# Altium schematic sheet 04_Power.SchDoc
size A; SheetNumber: 4; SheetTotal: 5
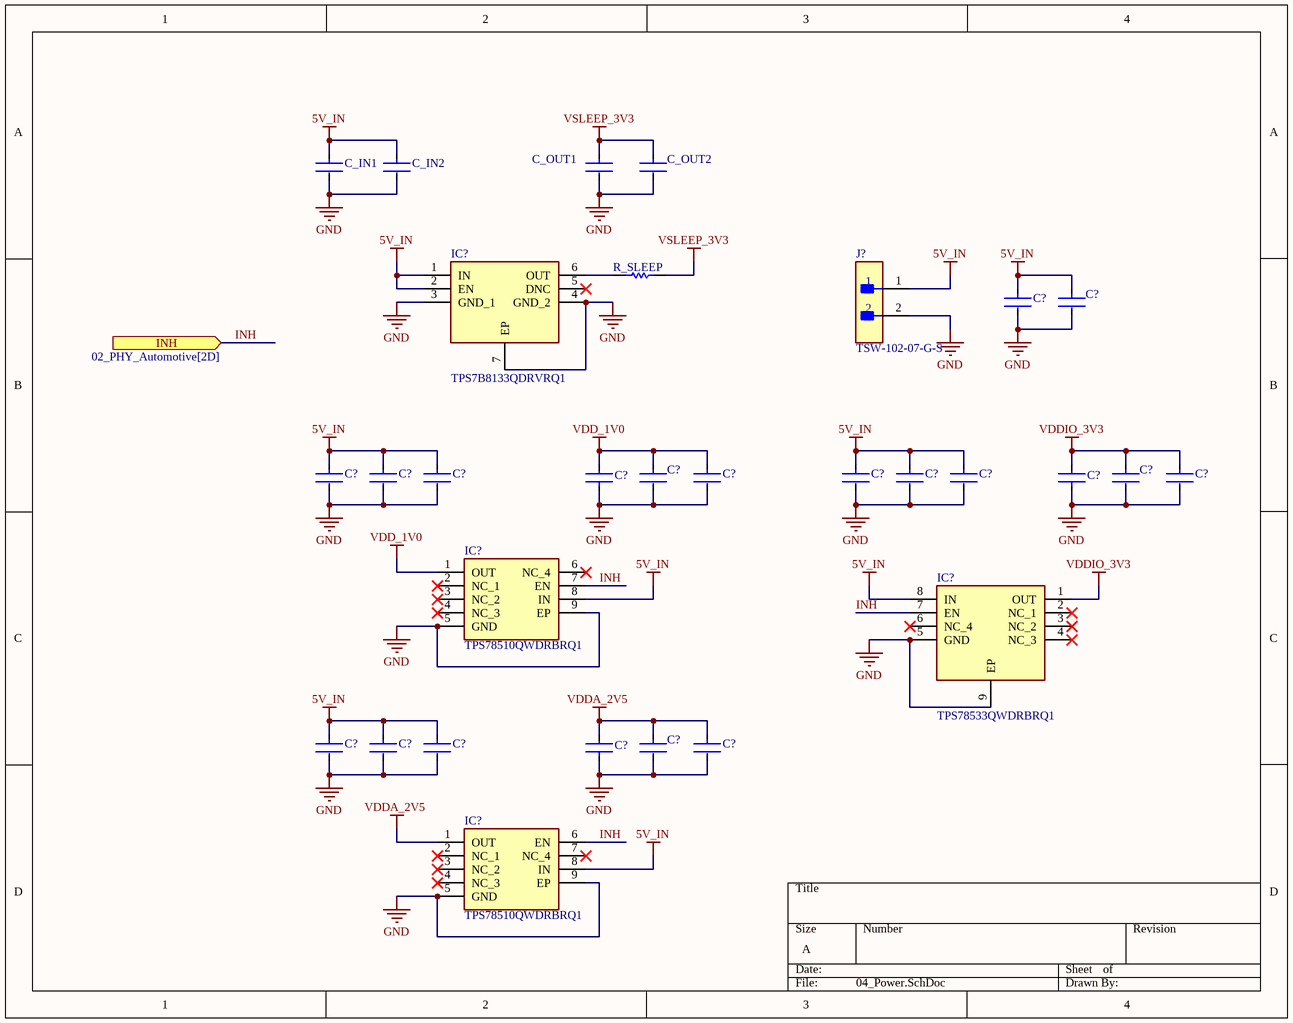
[diagram p0: 04_Power.SchDoc]

## Parts
(Parts that share a designator on the sheet are numbered #1, #2 ... from top to bottom, then left to right.)
C?#1  GCM32ER71C226ME19K  [FP-GCM32E-0_3-IPC_A]  (value not drawn)
C?#2  GCG155R71C104KA01D  [FP-GCG155-0_1-IPC_C]  (value not drawn)
C?#3  C1206C106K4RACAUTO  [FP-C1206C-EH-MFG]  (value not drawn)
C?#4  GCG155R71C104KA01D  [FP-GCG155-0_1-IPC_C]  (value not drawn)
C?#5  (no value)  [FP-GCG155-0_1-IPC_C]
C?#6  GCG155R71C104KA01D  [FP-GCG155-0_1-IPC_C]  (value not drawn)
C?#7  (no value)  [FP-GCG155-0_1-IPC_C]
C?#8  C1206C106K4RACAUTO  [FP-C1206C-EH-MFG]  (value not drawn)
C?#9  GCG155R71C104KA01D  [FP-GCG155-0_1-IPC_C]  (value not drawn)
C?#10  (no value)  [FP-GCG155-0_1-IPC_C]
C?#11  GCG155R71C104KA01D  [FP-GCG155-0_1-IPC_C]  (value not drawn)
C?#12  (no value)  [FP-GCG155-0_1-IPC_C]
C?#13  C0603C105K8RACAUTO  [FP-C0603-CJ-MFG]  (value not drawn)
C?#14  C0603C105K8RACAUTO  [FP-C0603-CJ-MFG]  (value not drawn)
C?#15  C1206C106K4RACAUTO  [FP-C1206C-EH-MFG]  (value not drawn)
C?#16  GCG155R71C104KA01D  [FP-GCG155-0_1-IPC_C]  (value not drawn)
C?#17  (no value)  [FP-GCG155-0_1-IPC_C]
C?#18  GCG155R71C104KA01D  [FP-GCG155-0_1-IPC_C]  (value not drawn)
C?#19  (no value)  [FP-GCG155-0_1-IPC_C]
C?#20  C0603C105K8RACAUTO  [FP-C0603-CJ-MFG]  (value not drawn)
C_IN1  C1206C106K4RACAUTO  [FP-C1206C-EH-MFG]  (value not drawn)
C_IN2  GCG155R71C104KA01D  [FP-GCG155-0_1-IPC_C]  (value not drawn)
C_OUT1  C1206C106K4RACAUTO  [FP-C1206C-EH-MFG]  (value not drawn)
C_OUT2  GCG155R71C104KA01D  [FP-GCG155-0_1-IPC_C]  (value not drawn)
IC?#1  TPS7B8133QDRVRQ1  [SON65P200X200X80-7N]
IC?#2  TPS78510QWDRBRQ1  [TPS78510QWDRBRQ1]
IC?#3  TPS78533QWDRBRQ1  [SON65P300X300X100-9N-D]
IC?#4  TPS78510QWDRBRQ1  [TPS78510QWDRBRQ1]
J?  TSW-102-07-G-S  [FP-TSW-102-07-G-S-MFG]
R_SLEEP  AF0402JR-070RL  [FP-AC0402-IPC_A]  (value not drawn)

## Ports
INH (in, see 02_PHY_Automotive[2D])

## Nets
5V_IN: C?#1.2 C?#2.1 C?#3.1 C?#4.1 C?#5.1 C?#8.1 C?#9.1 C?#10.1 C?#15.1 C?#16.1 C?#17.1 C_IN1.1 C_IN2.1 IC?#1.1(IN) IC?#1.2(EN) IC?#2.8(IN) IC?#3.8(IN) IC?#4.8(IN) J?.1
GND: C?#1.1 C?#2.2 C?#3.2 C?#4.2 C?#5.2 C?#6.2 C?#7.2 C?#8.2 C?#9.2 C?#10.2 C?#11.2 C?#12.2 C?#13.2 C?#14.2 C?#15.2 C?#16.2 C?#17.2 C?#18.2 C?#19.2 C?#20.2 C_IN1.2 C_IN2.2 C_OUT1.2 C_OUT2.2 IC?#1.3(GND_1) IC?#1.4(GND_2) IC?#1.7(EP) IC?#2.5(GND) IC?#2.9(EP) IC?#3.5(GND) IC?#3.9(EP) IC?#4.5(GND) IC?#4.9(EP) J?.2
VDD_1V0: C?#6.1 C?#7.1 C?#13.1 IC?#2.1(OUT)
VDDA_2V5 : C?#18.1 C?#19.1 C?#20.1 IC?#4.1(OUT)
VDDIO_3V3: C?#11.1 C?#12.1 C?#14.1 IC?#3.1(OUT)
VSLEEP_3V3: C_OUT1.1 C_OUT2.1 R_SLEEP.1
INH: IC?#2.7(EN) IC?#3.7(EN) IC?#4.6(EN) ; port INH
NetIC?#1_6: IC?#1.6(OUT) R_SLEEP.2

Not connected (* = marked no-connect by the designer): IC?#1 5(DNC)*; IC?#2 2(NC_1)* 3(NC_2)* 4(NC_3)* 6(NC_4)*; IC?#3 2(NC_1)* 3(NC_2)* 4(NC_3)* 6(NC_4)*; IC?#4 2(NC_1)* 3(NC_2)* 4(NC_3)* 7(NC_4)*

## Library data of the parts
C?#1 = CMP-06035-020351-1: Ceramic Capacitor for Automotive 22uF ±20% 16VDC X7R 1210 Embossed T/R; Voltage Rating: 16V; Case Code (Imperial): 1210; Package Quantity: 4000; Min Operating Temperature: -55°C; Thickness: 0.106inch; Case/Package: 1210; Height: 2.5mm; Width: 0.098inch; Dielectric: X7R; Ratings: AEC-Q200; Case Code (Metric): 3225; Weight: 0.00388oz; Voltage Rating (DC): 16V; Length: 0.126inch; Tolerance: 20%; Capacitance: 22uF; Mount: Surface Mount; Packaging: Tape and Reel; Max Operating Temperature: 125°C; Termination: SMD/SMT
C?#2 C?#4 C?#6 C?#9 C?#11 C?#16 C?#18 C_IN2 C_OUT2 = CMP-06035-054249-1: Cap Ceramic Multilayer Automotive 0.1uF ±0.1 16VDC X7R 15% 0402 (1005M); Capacitance: 100nF; Tolerance: 10%; Voltage Rating (DC): 16V; Lead Free: Lead Free; Dielectric: X7R
C?#3 C?#8 C?#15 = CMP-03020-003375-1: CAP CER 10UF 16V X7R 1206; Manufacturer: Kemet; Material: Ceramic; Temperature Coefficient: 15%; Tolerance: 10%; Automotive Grade: Grade 1; Manufacturer Part Number: C1206C106K4RACAUTO; Digikey Description: CAP CER 10UF 16V X7R 1206; RoHS: TRUE; Temperature Range Low: -55°C; Ipc Land Pattern Name: CAPC320160X160; Category: Cap; Mouser Description: Multilayer Ceramic Capacitors MLCC - SMD/SMT 10uF 16V 10% AUTO; Device Class L1: Passive Components; Automotive: Yes; ComponentLink2Description: Datasheet; Octopart: https://octopart.com/c1206c106k4racauto-kemet-20072893; Package: C1206C-EH; Temperature: -55°C to +125°C; Device Class L3: Ceramic Capacitors; Device Class L2: Capacitors; Temperature Range High: +125°C; Capacitance: 10uF; Value: 10uF; Lead Free: Yes; Height: 1.8mm; Temperature Characteristic: X7R; ComponentLink2URL: https://content.kemet.com/datasheets/KEM_C1023_X7R_AUTO_SMD.pdf; Voltage Rating: 16V
C?#5 C?#7 C?#10 C?#12 C?#17 C?#19 = CMP-06035-054249-1: Multilayer Ceramic Capacitors MLCC - SMD/SMT 16V 0.047uF X7R 0402 10% AEC-Q200; Manufacturer: Yageo Group; Manufacturer Part Number: C0402C473K4RACAUTO; Value: 47nF; Supplier: Avnet; Supplier Part Number: C0402C473K4RACAUTO; RoHS: Compliant; Category: Ceramic Capacitors; Stock: 10000; Pricing: 1=0.142, 25=0.072, 100=0.071, 250=0.069, 500=0.068, 1000=0.066, 2500=0.065 (USD); Case/Package: 0402; China RoHS: Compliant; Country of Origin: Mexico; Dielectric: X7R; Dielectric Material: Ceramic; Export Control Classification Number (ECCN) Code: EAR99; Height: 500µm; Harmonized Tariff Schedule (HTS) Code: 8532.24.00.20; Introduction Date: 2012-06-13; Length: 1mm; Lifecycle Status: Production; Material: Ceramic; Max Operating Temperature: 125°C; Min Operating Temperature: -55°C; Mounting Technology: Surface Mount; Pins: 2; Number of Terminals: 2; Ratings: AEC-Q200; REACH SVHC: Unaffected; Schedule B: 8532240020, 8532240020|8532240020|8532240020|8532240020|8532240020; Tolerance: 10%; Voltage Rating: 16V; Voltage Rating (DC): 16V; Width: 500µm; ComponentLink1URL: https://datasheet.octopart.com:443/C0402C473K4RACAUTO-KEMET-datasheet-178087915.pdf?src-supplier=Farnell; ComponentLink1Description: https://datasheet.octopart.com:443/C0402C473K4RACAUTO-KEMET-datasheet-178087915.pdf?src-supplier=Farnell; ComponentLink2URL: https://datasheet.octopart.com:443/C0402C473K4RACAUTO-KEMET-datasheet-149521753.pdf?src-supplier=Farnell; ComponentLink2Description: https://datasheet.octopart.com:443/C0402C473K4RACAUTO-KEMET-datasheet-149521753.pdf?src-supplier=Farnell; ComponentLink3URL: https://datasheet.octopart.com:443/C0402C473K4RACAUTO-KEMET-datasheet-101607585.pdf?src-supplier=Farnell; ComponentLink3Description: https://datasheet.octopart.com:443/C0402C473K4RACAUTO-KEMET-datasheet-101607585.pdf?src-supplier=Farnell; ComponentLink4URL: https://datasheet.octopart.com:443/C0402C473K4RACAUTO-KEMET-datasheet-138896278.pdf?src-supplier=Farnell; ComponentLink4Description: https://datasheet.octopart.com:443/C0402C473K4RACAUTO-KEMET-datasheet-138896278.pdf?src-supplier=Farnell; ComponentLink5URL: https://datasheet.octopart.com:443/C0402C473K4RACAUTO-KEMET-datasheet-137357759.pdf?src-supplier=Master+Electronics; ComponentLink5Description: https://datasheet.octopart.com:443/C0402C473K4RACAUTO-KEMET-datasheet-137357759.pdf?src-supplier=Master+Electronics; ComponentLink6URL: https://datasheet.octopart.com:443/C0402C473K4RACAUTO-KEMET-datasheet-153706760.pdf?src-supplier=Electro+Sonic; ComponentLink6Description: https://datasheet.octopart.com:443/C0402C473K4RACAUTO-KEMET-datasheet-153706760.pdf?src-supplier=Electro+Sonic; ComponentLink7URL: https://datasheet.octopart.com:443/C0402C473K4RACAUTO-KEMET-datasheet-153410967.pdf?src-supplier=LKR; ComponentLink7Description: https://datasheet.octopart.com:443/C0402C473K4RACAUTO-KEMET-datasheet-153410967.pdf?src-supplier=LKR; ComponentLink8URL: https://datasheet.octopart.com:443/C0402C473K4RACAUTO-KEMET-datasheet-130259128.pdf?src-supplier=TME; ComponentLink8Description: https://datasheet.octopart.com:443/C0402C473K4RACAUTO-KEMET-datasheet-130259128.pdf?src-supplier=TME; ComponentLink9URL: https://datasheet.octopart.com:443/C0402C473K4RACAUTO-KEMET-datasheet-130256447.pdf?src-supplier=TME; ComponentLink9Description: https://datasheet.octopart.com:443/C0402C473K4RACAUTO-KEMET-datasheet-130256447.pdf?src-supplier=TME; ComponentLink10URL: https://datasheet.octopart.com/C0402C473K4RACAUTO-KEMET-datasheet-84169754.pdf; ComponentLink10Description: https://datasheet.octopart.com/C0402C473K4RACAUTO-KEMET-datasheet-84169754.pdf
C?#13 C?#14 C?#20 = CMP-03020-024138-1: CAP CER 0603 1UF 10V X7R 10%; Manufacturer: KEMET; Temperature Coefficient: 15%; Automotive Grade: Grade 1; Material: Ceramic; Device Class L3: Ceramic Capacitors; Octopart: https://octopart.com/c0603c105k8racauto-kemet-91328492; Capacitance: 1uF; Voltage Rating: 10V; Device Class L2: Capacitors; Lead Free: Yes; Device Class L1: Passive Components; ComponentLink2URL: https://content.kemet.com/datasheets/KEM_C1023_X7R_AUTO_SMD.pdf; Temperature Characteristic: X7R; Temperature Range Low: -55°C; Temperature Range High: +125°C; Category: Cap; Ipc Land Pattern Name: CAPC16080X80; Tolerance: 10%; Package: C0603-CJ; Manufacturer Part Number: C0603C105K8RACAUTO; ComponentLink2Description: Datasheet; Temperature: -55°C to +125°C; RoHS: TRUE; Value: 1uF; Height: 0.95mm; Automotive: Yes; Digikey Description: CAP CER 0603 1UF 10V X7R 10%
C_IN1 C_OUT1 = CMP-03020-003375-1: CAP CER 10UF 16V X7R 1206; Manufacturer: Kemet; Temperature Coefficient: 15%; Tolerance: 10%; Automotive Grade: Grade 1; Manufacturer Part Number: C1206C106K4RACAUTO; Digikey Description: CAP CER 10UF 16V X7R 1206; RoHS: TRUE; Temperature Range Low: -55°C; Material: Ceramic; Ipc Land Pattern Name: CAPC320160X160; Category: Cap; Mouser Description: Multilayer Ceramic Capacitors MLCC - SMD/SMT 10uF 16V 10% AUTO; Device Class L1: Passive Components; Automotive: Yes; ComponentLink2Description: Datasheet; Octopart: https://octopart.com/c1206c106k4racauto-kemet-20072893; Package: C1206C-EH; Temperature: -55°C to +125°C; Device Class L3: Ceramic Capacitors; Device Class L2: Capacitors; Temperature Range High: +125°C; Capacitance: 10uF; Value: 10uF; Lead Free: Yes; Height: 1.8mm; Temperature Characteristic: X7R; ComponentLink2URL: https://content.kemet.com/datasheets/KEM_C1023_X7R_AUTO_SMD.pdf; Voltage Rating: 16V
IC?#1 = TPS7B8133QDRVRQ1: Integrated Circuit; Manufacturer_Name: Texas Instruments; Datasheet Link: http://www.ti.com/lit/gpn/TPS7B81-Q1; Height: 0.8mm; Manufacturer_Part_Number: TPS7B8133QDRVRQ1; Mouser Part Number: 595-TPS7B8133QDRVRQ1; Mouser Price/Stock: https://www.mouser.co.uk/ProductDetail/Texas-Instruments/TPS7B8133QDRVRQ1?qs=T3oQrply3y%252BtI31t7KSUmw%3D%3D; Arrow Part Number: TPS7B8133QDRVRQ1; Arrow Price/Stock: https://www.arrow.com/en/products/tps7b8133qdrvrq1/texas-instruments.html?utm_currency=USD&region=nac
IC?#2 IC?#4 = TPS78510QWDRBRQ1: Integrated Circuit; Manufacturer_Name: Texas Instruments; Datasheet Link: https://www.ti.com/lit/ds/symlink/tps785-q1.pdf?ts=1654240765019&ref_url=https%253A%252F%252Fcomponentsearchengine.com%252F; Height: 1mm; Manufacturer_Part_Number: TPS78510QWDRBRQ1; Mouser Part Number: 595-TPS78510QWDRBRQ1; Mouser Price/Stock: https://www.mouser.co.uk/ProductDetail/Texas-Instruments/TPS78510QWDRBRQ1?qs=iLbezkQI%252BsglWOoYBSvTYg%3D%3D; Arrow Part Number: TPS78510QWDRBRQ1; Arrow Price/Stock: https://www.arrow.com/en/products/tps78510qwdrbrq1/texas-instruments?region=nac
IC?#3 = TPS78533QWDRBRQ1: Integrated Circuit; Manufacturer_Name: Texas Instruments; Datasheet Link: https://www.arrow.com/en/products/tps78533qwdrbrq1/texas-instruments?region=nac; Height: 1mm; Manufacturer_Part_Number: TPS78533QWDRBRQ1; Mouser Part Number: 595-TPS78533QWDRBRQ1; Mouser Price/Stock: https://www.mouser.co.uk/ProductDetail/Texas-Instruments/TPS78533QWDRBRQ1?qs=iLbezkQI%252BsiNbdqh2Ko9GQ%3D%3D; Arrow Part Number: TPS78533QWDRBRQ1; Arrow Price/Stock: https://www.arrow.com/en/products/tps78533qwdrbrq1/texas-instruments?utm_currency=USD&region=nac
J? = CMP-02766-000084-1: CONN HEADER VERT 2POS 2.54MM; Manufacturer: Samtec; Number Of Contacts: 2; Voltage Rating: 550V; Conn Orientation: Straight; Current Rating: 6.3A; Description: Connector Header Through Hole 2 position 0.100" (2.54mm); Conn Gender: Male; Package: TSW-102-07-G-S; Digikey Description: CONN HEADER VERT 2POS 2.54MM; ComponentLink2URL: http://suddendocs.samtec.com/catalog_english/tsw_th.pdf; Height: 8.71mm; Temperature: -55°C to +125°C; Device Class L2: Headers and Wire Housings; ComponentLink2Description: Datasheet; Device Class L3: unset; Contact Material: Gold,Nickel; Temperature Range Low: -55°C; Temperature Range High: +125°C; RoHS: TRUE; Device Class L1: Connectors; Mouser Description: Conn Unshrouded Header HDR 2 POS 2.54mm Solder ST Thru-Hole Automotive Bulk; Number Of Rows: 1; Category: Conn; Pitch: 2.54mm; Lead Free: Yes; Automotive: No; Manufacturer Part Number: TSW-102-07-G-S; Footprint Url: http://suddendocs.samtec.com/prints/tsw-xxx-xx-x-x-xx-xxx-footprint.pdf; Octopart: https://octopart.com/tsw-102-07-g-s-samtec-272197
R_SLEEP = CMP-2002-07181-1: Res Thick Film 0402 0 Ohm Sulfur Resistant Pad SMD T/R Automotive AEC-Q200; Manufacturer: Yageo Group; Max Power Dissipation: 63mW; Power Rating: 62.5mW; Value: 0Ω; Temperature Coefficient: 100ppm/°C; Tolerance: 5%; Voltage Rating: 50V; Supplier: Mouser; Supplier Part Number: 603-AF0402JR-070RL; Manufacturer Part Number: AF0402JR-070RL; RoHS: Compliant; Category: Chip SMD Resistors; Stock: 203771; Pricing: 1=0.12, 10=0.015, 50=0.015, 100=0.010, 1000=0.009, 10000=0.006 (USD); Case/Package: 0402; Case Code (Imperial): 0402; Case Code (Metric): 1005; China RoHS: Non-Compliant; Composition: Thick Film; Country of Origin: Mainland China, Taiwan; Export Control Classification Number (ECCN) Code: EAR99; Features: Anti-Sulfur, Moisture Resistant; Height: 350µm; Harmonized Tariff Schedule (HTS) Code: 8533.21.00.30; Introduction Date: 2012-05-08; Length: 1mm; Lifecycle Status: Production; Max Operating Temperature: 155°C; Min Operating Temperature: -55°C; Mounting Technology: Surface Mount; Number of Terminals: 2; Number of Terminations: 2; Packaging: Tape & Reel; Ratings: AEC-Q200; REACH SVHC: Unaffected; Termination: SMD/SMT; Weight: 652.039032µg; Width: 500µm; ComponentLink1URL: https://datasheet.octopart.com:443/AF0402JR-070RL-Yageo-Group-datasheet-182189395.pdf?src-supplier=IHS; ComponentLink1Description: https://datasheet.octopart.com:443/AF0402JR-070RL-Yageo-Group-datasheet-182189395.pdf?src-supplier=IHS; ComponentLink2URL: https://datasheet.octopart.com:443/AF0402JR-070RL-Yageo-datasheet-182189397.pdf?src-supplier=IHS; ComponentLink2Description: https://datasheet.octopart.com:443/AF0402JR-070RL-Yageo-datasheet-182189397.pdf?src-supplier=IHS; ComponentLink3URL: https://datasheet.octopart.com:443/AF0402JR-070RL-Yageo-datasheet-153645569.pdf?src-supplier=Upverter; ComponentLink3Description: https://datasheet.octopart.com:443/AF0402JR-070RL-Yageo-datasheet-153645569.pdf?src-supplier=Upverter; ComponentLink4URL: https://sigma.octopart.com:443/138820526/technical_drawing/Yageo-AF0402JR-070RL.pdf?src-supplier=Upverter; ComponentLink4Description: https://sigma.octopart.com:443/138820526/technical_drawing/Yageo-AF0402JR-070RL.pdf?src-supplier=Upverter; ComponentLink5URL: https://datasheet.octopart.com/AF0402JR-070RL-Yageo-datasheet-68296209.pdf; ComponentLink5Description: https://datasheet.octopart.com/AF0402JR-070RL-Yageo-datasheet-68296209.pdf; ComponentLink6URL: https://datasheet.octopart.com:443/AF0402JR-070RL-Yageo-Group-datasheet-183876366.pdf?src-supplier=LCSC; ComponentLink6Description: https://datasheet.octopart.com:443/AF0402JR-070RL-Yageo-Group-datasheet-183876366.pdf?src-supplier=LCSC; ComponentLink7URL: https://datasheet.octopart.com:443/AF0402JR-070RL-Yageo-Group-datasheet-188689510.pdf?src-supplier=Farnell; ComponentLink7Description: https://datasheet.octopart.com:443/AF0402JR-070RL-Yageo-Group-datasheet-188689510.pdf?src-supplier=Farnell; ComponentLink8URL: https://datasheet.octopart.com:443/AF0402JR-070RL-Yageo-datasheet-164730775.pdf?src-supplier=Future+Electronics; ComponentLink8Description: https://datasheet.octopart.com:443/AF0402JR-070RL-Yageo-datasheet-164730775.pdf?src-supplier=Future+Electronics; ComponentLink9URL: https://datasheet.octopart.com:443/AF0402JR-070RL-Yageo-datasheet-137481464.pdf?src-supplier=Future+Electronics; ComponentLink9Description: https://datasheet.octopart.com:443/AF0402JR-070RL-Yageo-datasheet-137481464.pdf?src-supplier=Future+Electronics; ComponentLink10URL: http://sigma.octopart.com:80/conflict_mineral_statement/Yageo-company-3.pdf?src-supplier=Compliance+Statements; ComponentLink10Description: http://sigma.octopart.com:80/conflict_mineral_statement/Yageo-company-3.pdf?src-supplier=Compliance+Statements; ComponentLink11URL: http://sigma.octopart.com:80/rohs_statement/Yageo-company-2.pdf?src-supplier=Compliance+Statements; ComponentLink11Description: http://sigma.octopart.com:80/rohs_statement/Yageo-company-2.pdf?src-supplier=Compliance+Statements